# Altium schematic sheet 04 Debug&TF card&RTC.SchDoc
size A3; Revision: V1.2; SheetNumber: 4; SheetTotal: 11
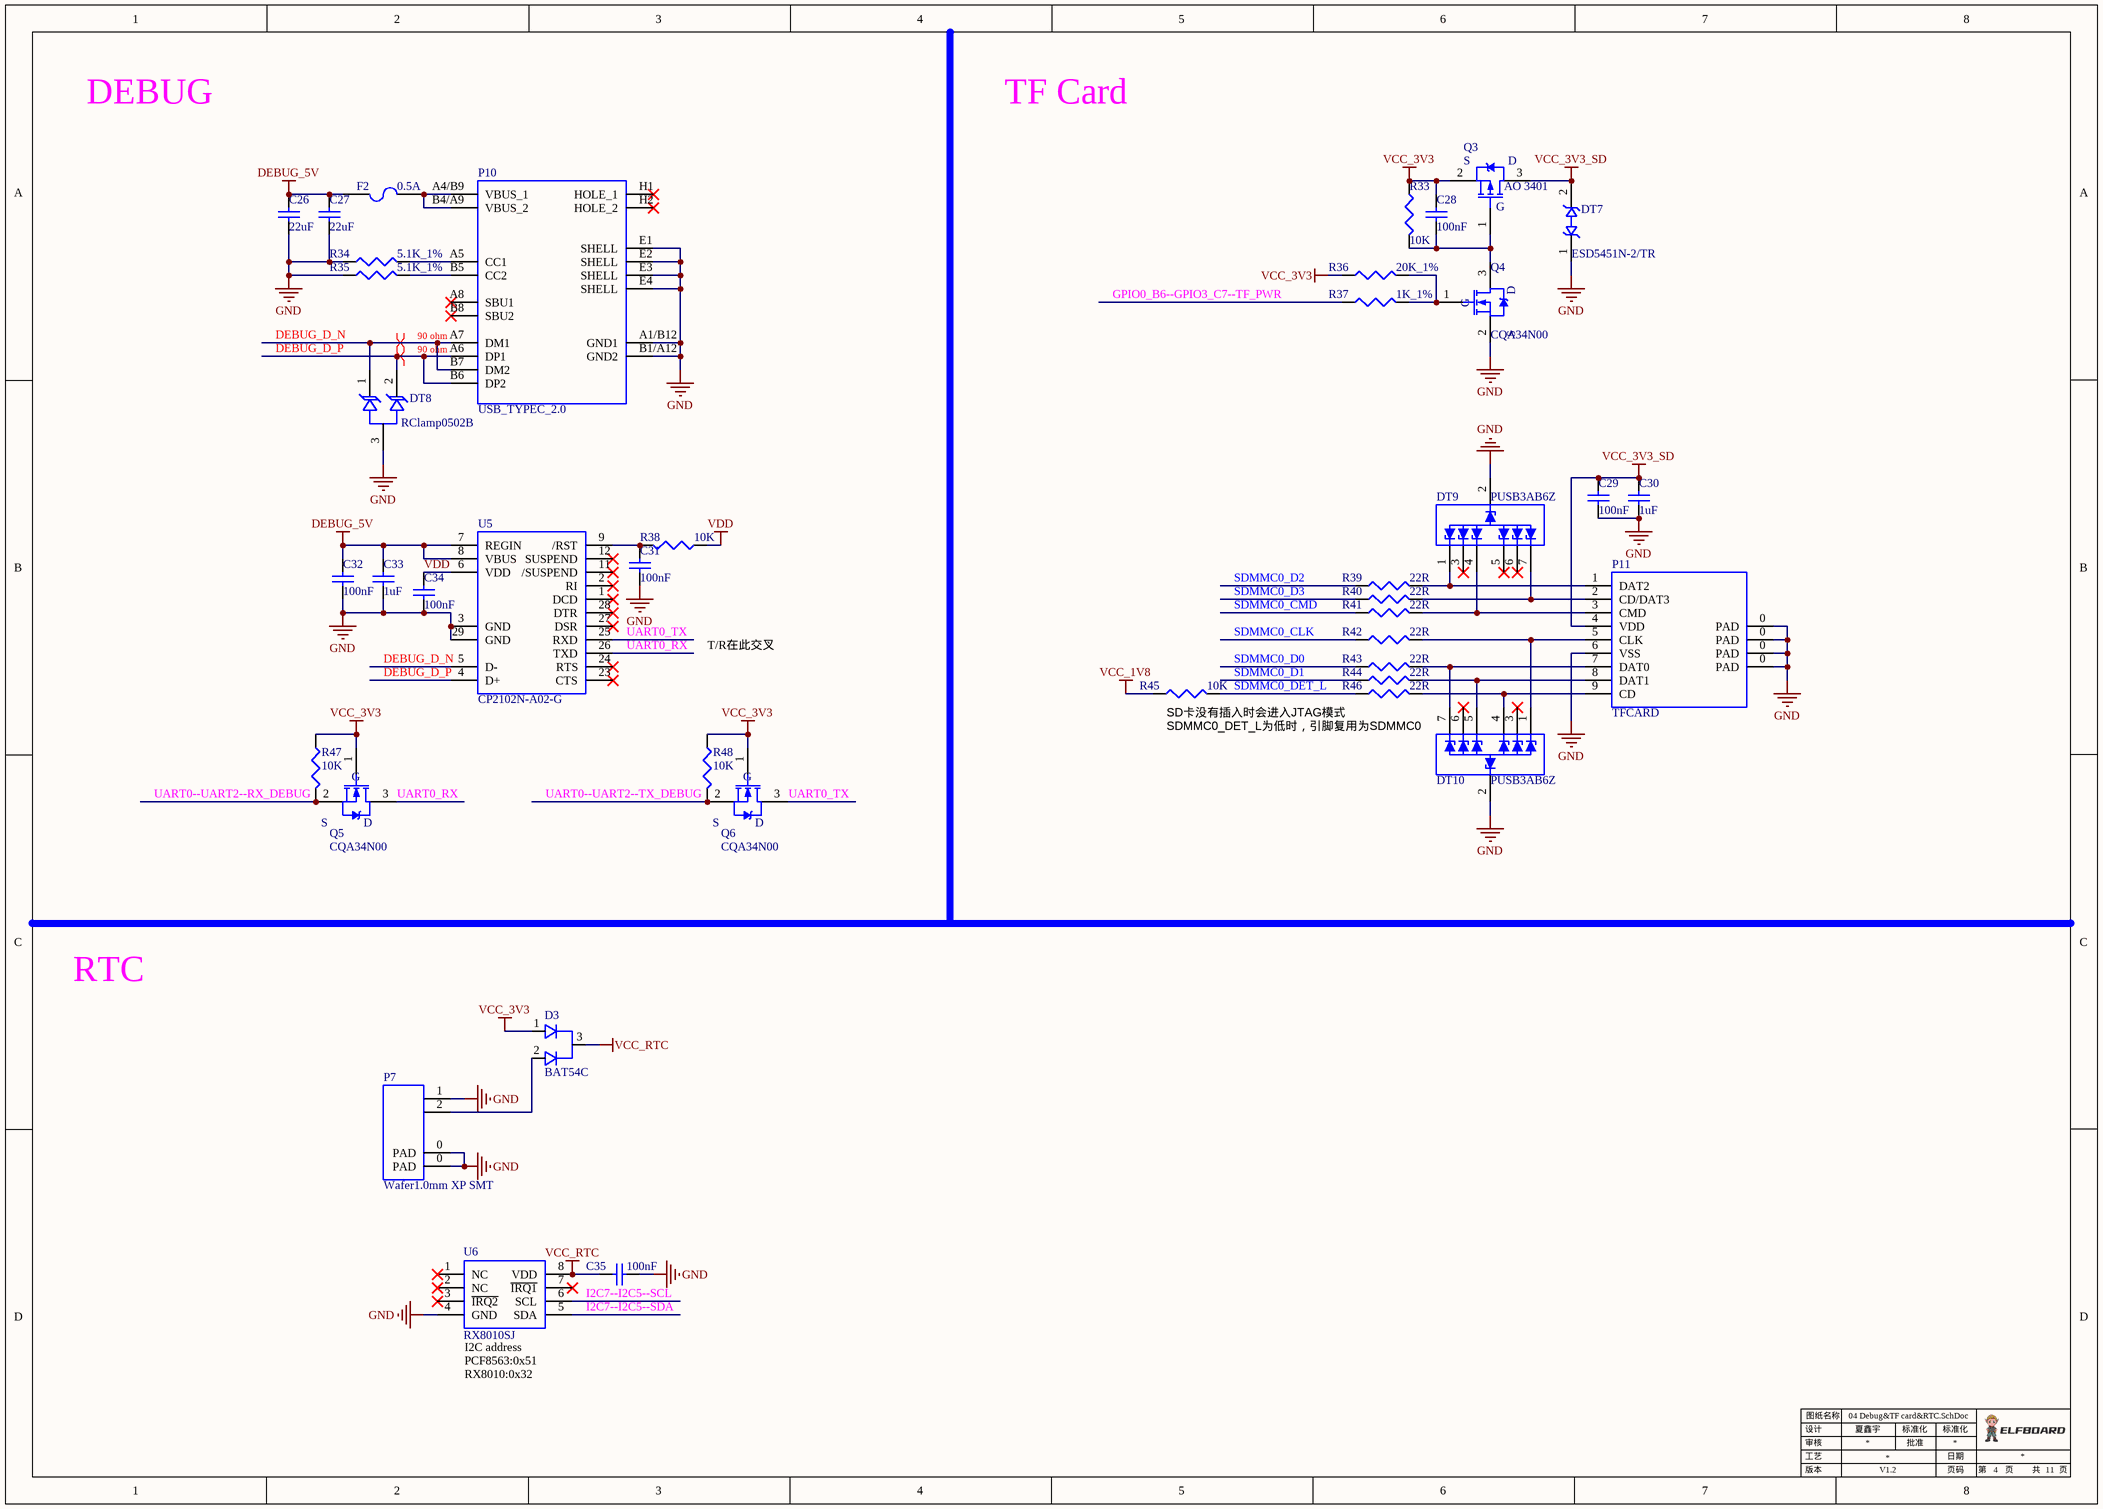
[diagram p0: 04 Debug&TF card&RTC.SchDoc]

## Parts
C26  22uF  [0603C]
C27  22uF  [0603C]
C28  100nF  [0402C]
C29  100nF  [0402C]
C30  1uF  [0402C]
C31  100nF  [0402C]
C32  100nF  [0402C]
C33  1uF  [0402C]
C34  100nF  [0402C]
C35  100nF  [0402C]
D3  BAT54C  [SOT_233_N]
DT7  ESD5451N-2/TR  [0402TVS]
DT8  RClamp0502B  [SOT_523]
DT9  PUSB3AB6Z  [DFN2111-7]
DT10  PUSB3AB6Z  [DFN2111-7]
F2  0.5A  [1210F]
P7  Wafer1.0mm XP SMT  [CON2-1-4X3_1-H4_3]
P10  USB_TYPEC_2.0  [USB_TYPE-C_S]
P11  TFCARD  [TF_CARD_SELF]
Q3  AO 3401  [SOT_233_W]
Q4  CQA34N00  [SOT_233_W]
Q5  CQA34N00  [SOT_233_W]
Q6  CQA34N00  [SOT_233_W]
R33  10K  [0402R]
R34  5.1K_1%  [0402R]
R35  5.1K_1%  [0402R]
R36  20K_1%  [0402R]
R37  1K_1%  [0402R]
R38  10K  [0402R]
R39  22R  [0402R]
R40  22R  [0402R]
R41  22R  [0402R]
R42  22R  [0402R]
R43  22R  [0402R]
R44  22R  [0402R]
R45  10K  [0402R]
R46  22R  [0402R]
R47  10K  [0402R]
R48  10K  [0402R]
U5  CP2102N-A02-G  [QFN28P_0.5BSC_5*5_H]
U6  RX8010SJ  [SOP8_1.27-7.2x4-h2.65]

## Nets
DEBUG_5V: C26.2 C27.2 C32.2 C33.2 F2.2 U5.7(REGIN) U5.8(VBUS)
GND: C26.1 C27.1 C29.1 C30.1 C31.1 C32.1 C33.1 C34.1 C35.2 DT7.1 DT8.3 DT9.2 DT10.2 P7.0(PAD) P7.1 P10.A1/B12(GND1) P10.B1/A12(GND2) P10.E1(SHELL) P10.E2(SHELL) P10.E3(SHELL) P10.E4(SHELL) P11.0(PAD) P11.6(VSS) Q4.2(S) R34.1 R35.1 U5.3(GND) U5.29(GND) U6.4(GND)
VCC_1V8: R45.1
VCC_3V3: C28.2 D3.1 Q3.2(S) Q5.1(G) Q6.1(G) R33.1 R36.1 R47.1 R48.1
VCC_3V3_SD: C29.2 C30.2 DT7.2 P11.4(VDD) Q3.3(D)
VCC_RTC: C35.1 D3.3 U6.8(VDD)
VDD: C34.2 R38.1 U5.6(VDD)
DEBUG_D_N: DT8.1 P10.A7(DM1) P10.B7(DM2) U5.5(D-)
DEBUG_D_P: DT8.2 P10.A6(DP1) P10.B6(DP2) U5.4(D+)
GPIO0_B6--GPIO3_C7--TF_PWR: R37.1
I2C7--I2C5--SCL: U6.6(SCL)
I2C7--I2C5--SDA: U6.5(SDA)
SDMMC0_CLK: R42.1
SDMMC0_CMD: R41.1
SDMMC0_D0: R43.1
SDMMC0_D1: R44.1
SDMMC0_D2: R39.1
SDMMC0_D3: R40.1
SDMMC0_DET_L: R45.2 R46.1
UART0--UART2--RX_DEBUG: Q5.2(S) R47.2
UART0--UART2--TX_DEBUG: Q6.2(S) R48.2
UART0_RX: Q5.3(D) U5.26(TXD)
UART0_TX: Q6.3(D) U5.25(RXD)
NetC28_1: C28.1 Q3.1(G) Q4.3(D) R33.2
NetC31_2: C31.2 R38.2 U5.9(/RST)
NetD3_2: D3.2 P7.2
NetDT9_1: DT9.1 P11.1(DAT2) R39.2
NetDT9_4: DT9.4 P11.3(CMD) R41.2
NetDT9_7: DT9.7 P11.2(CD/DAT3) R40.2
NetDT10_1: DT10.1 P11.5(CLK) R42.2
NetDT10_4: DT10.4 P11.9(CD) R46.2
NetDT10_5: DT10.5 P11.8(DAT1) R44.2
NetDT10_7: DT10.7 P11.7(DAT0) R43.2
NetF2_1: F2.1 P10.A4/B9(VBUS_1) P10.B4/A9(VBUS_2)
NetP10_A5: P10.A5(CC1) R34.2
NetP10_B5: P10.B5(CC2) R35.2
NetQ4_1: Q4.1(G) R36.2 R37.2

Not connected (* = marked no-connect by the designer): DT9 3* 5* 6*; DT10 3* 6*; P10 A8(SBU1)* B8(SBU2)* H1(HOLE_1)* H2(HOLE_2)*; U5 1(DCD)* 2(RI)* 11(/SUSPEND)* 12(SUSPEND)* 23(CTS)* 24(RTS)* 27(DSR)* 28(DTR)*; U6 1(NC)* 2(NC)* 3(~{IRQ2})* 7(~{IRQ1})*

## Layout directives
differential pair; differential pair class 90 ohm: DEBUG_D_N, DEBUG_D_P

## Notes on the sheet
- DEBUG
- TF Card
- T/R在此交叉
- (near R45) SD卡没有插入时会进入JTAG模式
- (near R45) SDMMC0_DET_L为低时，引脚复用为SDMMC0
- RTC
- (near U6) PCF8563:0x51
- (near U6) I2C address
- RX8010:0x32
- 设计
- 审核
- 工艺
- 图纸名称
- 夏鑫宇
- 批准
- 标准化
- 日期
- 版本
- 页码
- 第
- 页
- 共

## Library data of the parts
C26 C27 = 1110203040: 序号: 675; 存货名称: 贴装叠层陶瓷电容; 规格型号: 0603,22uF,6.3V,±20％,X5R; 主计量单位名称: 个; 安全库存: 678357; 旧编码: 010202048; 旧规格型号: 0603 22uF 6.3V ±20％ X5R; Published: 8-Jun-2000; LatestRevisionDate: 17-Jul-2002; LatestRevisionNote: Re-released for DXP Platform.; PackageReference: RAD-0.3; Publisher: Altium Limited; PackageDescription: Radial Cap, Thru-Hole; 2 Leads; 0.3 in Pin Spacing; Value: 22uF; 存货编码: 1110203040
C28 C29 C35 = 1110202039: 序号: 626; 存货名称: 贴装叠层陶瓷电容; 规格型号: 0402,100nF,25V,±10％,X5R; Published: 8-Jun-2000; LatestRevisionDate: 17-Jul-2002; LatestRevisionNote: Re-released for DXP Platform.; PackageReference: RAD-0.3; Publisher: Altium Limited; PackageDescription: Radial Cap, Thru-Hole; 2 Leads; 0.3 in Pin Spacing; Value: 100nF; 存货编码: 1110202039
C30 C33 = 1110202002: 序号: 571; 存货名称: 贴装叠层陶瓷电容; 规格型号: 0402,1uF,10V,±10％,X5R; 主计量单位名称: 个; 安全库存: 499709; 旧编码: 010201002; 旧规格型号: 0402 1uF 10V ±10％ X5R; Published: 8-Jun-2000; LatestRevisionDate: 17-Jul-2002; LatestRevisionNote: Re-released for DXP Platform.; PackageReference: RAD-0.3; Publisher: Altium Limited; PackageDescription: Radial Cap, Thru-Hole; 2 Leads; 0.3 in Pin Spacing; Value: 1uF; 存货编码: 1110202002
C31 C32 C34 = 1110202001: 序号: 570; 存货名称: 贴装叠层陶瓷电容; 规格型号: 0402,100nF,16V,±10％,X7R; 主计量单位名称: 个; 安全库存: 2580445; 旧编码: 010201001; 旧规格型号: 0402 100nF 16V ±10％ X7R; Published: 8-Jun-2000; LatestRevisionDate: 17-Jul-2002; LatestRevisionNote: Re-released for DXP Platform.; PackageReference: RAD-0.3; Publisher: Altium Limited; PackageDescription: Radial Cap, Thru-Hole; 2 Leads; 0.3 in Pin Spacing; Value: 100nF; 存货编码: 1110202001
D3 = 1110501005: 序号: 2485; 存货名称: 双肖特基二极管; 规格型号: BAT54C,SOT-23-3; 安全库存: 3634; 旧编码: 010601007; 旧规格型号: BAT54C，SOT-23-3; Value: BAT54C; 存货编码: 1110501005
DT7 = 1110503036: 存货名称: TVS管; 规格型号: ESD5451N-2/TR,DFN1006-2L; Value: ESD5451N-2/TR; 存货编码: 1110503036
DT8 = 1110503016: 序号: 2598; 存货名称: TVS管; 规格型号: RC1amp0502B SOT-523; 主计量单位名称: 只; 安全库存: 2084.00; 旧编码: 010603010; Value: RClamp0502B; 存货编码: 1110503016; 启用日期: 2013/1/1
DT9 DT10 = 1110503004: 序号: 2555; 存货名称: TVS管; 规格型号: PUSB3AB6Z,xson7; 主计量单位名称: 只; 安全库存: 198; 旧编码: 010601080; 旧规格型号: PUSB3AB6Z xson7; 存货编码: 1110503004; Value: PUSB3AB6Z
F2 = 1110305006: 序号: 3432; 存货名称: 自恢复保险; 规格型号: 1210，0.5A; 主计量单位名称: 个; 安全库存: 4426.00; 旧编码: 010803008; Published: 8-Jun-2000; LatestRevisionDate: 17-Jul-2002; LatestRevisionNote: Re-released for DXP Platform.; PackageReference: PIN-W2/E2.8; Publisher: Altium Limited; PackageDescription: Thru-Hole; 2 Leads; 存货编码: 1110305006; Value: 0.5A; 启用日期: 2013/1/1
P7 = 1120101221: 存货名称: 贴装连接器; 规格型号: Wafer 镀锡,单排,母座,2P,1.0mm,卧贴-WF10002-01206; Value: Wafer1.0mm XP SMT; 存货编码: 1120101221
P10 = 1120102080: 序号: 8624; 存货名称: 贴装USB座; 规格型号: USB616FC-C2014245,USB2.0,type-c,母座,单层,横卧,16pin,(4个插装脚,脚长1.8),雾面; 描述: 深圳爱特姆; Value: USB_TYPEC_2.0; 存货编码: 1120102080
P11 = 1120104005: 序号: 2224; 存货名称: 贴装TF卡座; 规格型号: TFP09-2-12B,自弹式单弹,外焊; 禁用状态: 否; 存货编码: 1120104005; value: TFCARD
Q3 = 1110505061: Note: Pin 2 is electrically connected to pin 4.; 序号: 8103; 存货名称: 场效应管; 规格型号: AO3401A,SOT-23-3,P沟道; 描述: 替代1110505019，AOS（美国万代）; 近三年购买频次: 近三年购买频次.2; Published: 8-Jun-2000; LatestRevisionDate: 17-Jul-2002; LatestRevisionNote: Re-released for DXP Platform.; DatasheetVersion: PD-9.814; PackageVersion: Feb-1997; PackageReference: TO-220AB; Publisher: Altium Limited; PackageDescription: TO, Thru-Hole, Vertical, Heatsink Mounted; 3 In-Line Leads; Pitch 2.54 mm; ComponentLink1Description: Manufacturer Link; ComponentLink1URL: http://www.irf.com/; VALUE: AO 3401; 存货编码: 1110505061; 最近一次购买记录: 2025/2/18
Q4-Q6 = 1110505035: Note: Pin 2 is electrically connected to pin 4.; 序号: 5012; 存货名称: 场效应管; 规格型号: CQA34N00,SOT23,N沟道; 描述: 替代1110505027; 禁用状态: 否; Published: 8-Jun-2000; LatestRevisionDate: 17-Jul-2002; LatestRevisionNote: Re-released for DXP Platform.; DatasheetVersion: PD-9.814; PackageVersion: Feb-1997; PackageReference: TO-220AB; Publisher: Altium Limited; PackageDescription: TO, Thru-Hole, Vertical, Heatsink Mounted; 3 In-Line Leads; Pitch 2.54 mm; VALUE: CQA34N00; 存货编码: 1110505035
R33 R38 R45 R47 R48 = 1110102007: 序号: 17; 存货名称: 贴装电阻; 规格型号: 0402,10K,±5％; Value: 10K; 存货编码: 1110102007
R34 R35 = 1110102136: 存货名称: 贴装电阻; 规格型号: 0402,5.1K,±1％; Value: 5.1K_1%; 存货编码: 1110102136
R36 = 1110102074: 序号: 106; 存货名称: 贴装电阻; 规格型号: 0402,20K,±1％; Value: 20K_1%; 存货编码: 1110102074
R37 = 1110102011: 序号: 21; 存货名称: 贴装电阻; 规格型号: 0402,1K,±1％; Value: 1K_1%; 存货编码: 1110102011
R39-R44 R46 = 1110102028: 序号: 41; 存货名称: 贴装电阻; 规格型号: 0402,22Ω,±5％; Value: 22R; 存货编码: 1110102028
U5 = 1110405282: 序号: 1643; 存货名称: 常规IC; 规格型号: CP2102N-A02-G,QFN28; 描述: 替代1110405210; 禁用状态: 否; Value: CP2102N-A02-G; 存货编码: 1110405282
U6 = 1110405188: 序号: 1549; 存货名称: 常规IC; 规格型号: RX8010SJ,SO-8; 描述: 不推荐新品设计使用,1110405328改版替代,爱普生 时钟模块; 禁用状态: 否; Value: RX8010SJ; 存货编码: 1110405188